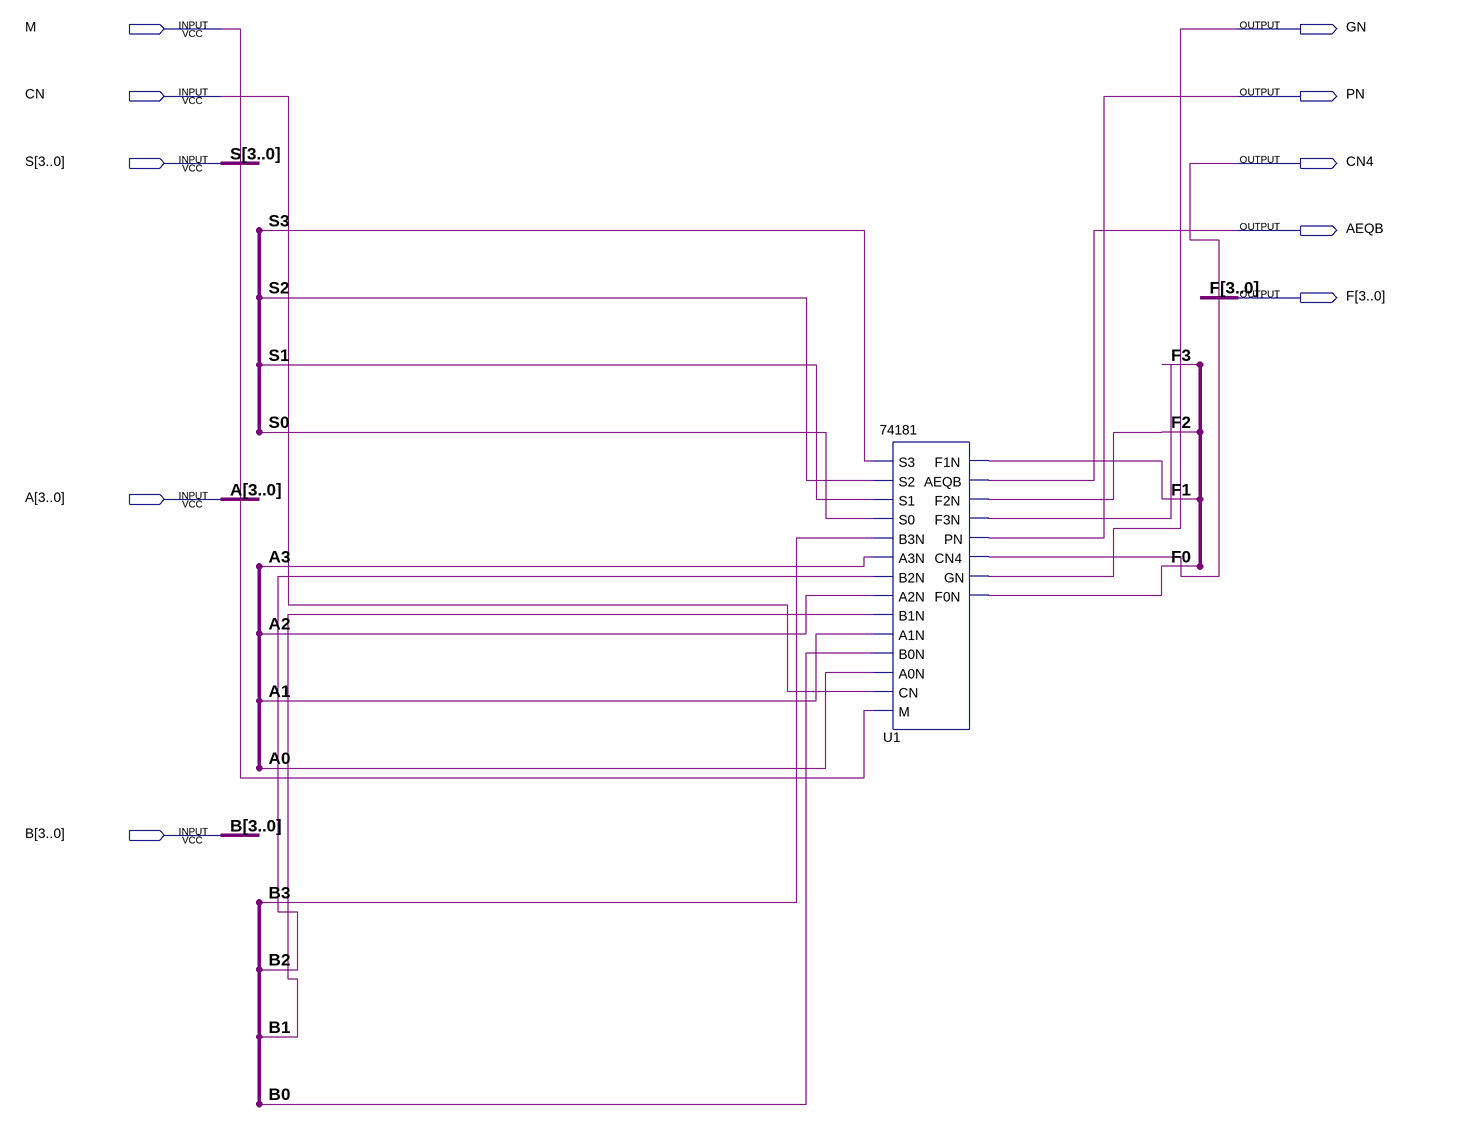
[diagram p0: schematic sheet]
// Quartus schematic alu4.bdf as structural Verilog: 1 symbols, 10 pins
module alu4 (
  input  M,
  input  CN,
  input  [3:0] S,
  input  [3:0] A,
  input  [3:0] B,
  output GN,
  output PN,
  output CN4,
  output AEQB,
  output [3:0] F
);

  \74181  U1 (
    .S3(S[3]), .S2(S[2]), .S1(S[1]), .S0(S[0]), .B3N(B[3]), .A3N(A[3]), .B2N(B[2]), .A2N(A[2]), .B1N(B[1]),
    .A1N(A[1]), .B0N(B[0]), .A0N(A[0]), .CN(CN), .M(M), .F1N(F[1]), .AEQB(AEQB), .F2N(F[2]), .F3N(F[3]),
    .PN(PN), .CN4(CN4), .GN(GN), .F0N(F[0]));
endmodule
